# Altium schematic sheet RJ-45_OUTPUT.SchDoc
size 420 x 297 mm; Author: Лотов М.Д.; Address1: Address1; Address2: Address2; Address3: Address3; Address4: Address4; DocumentNumber: RJ-45_OUTPUT; SheetNumber: 3; SheetTotal: 5; Scale: 1:1; DocumentType: Схема электрическая принципиальная; FirstReferrence: АБВГ.123456.001
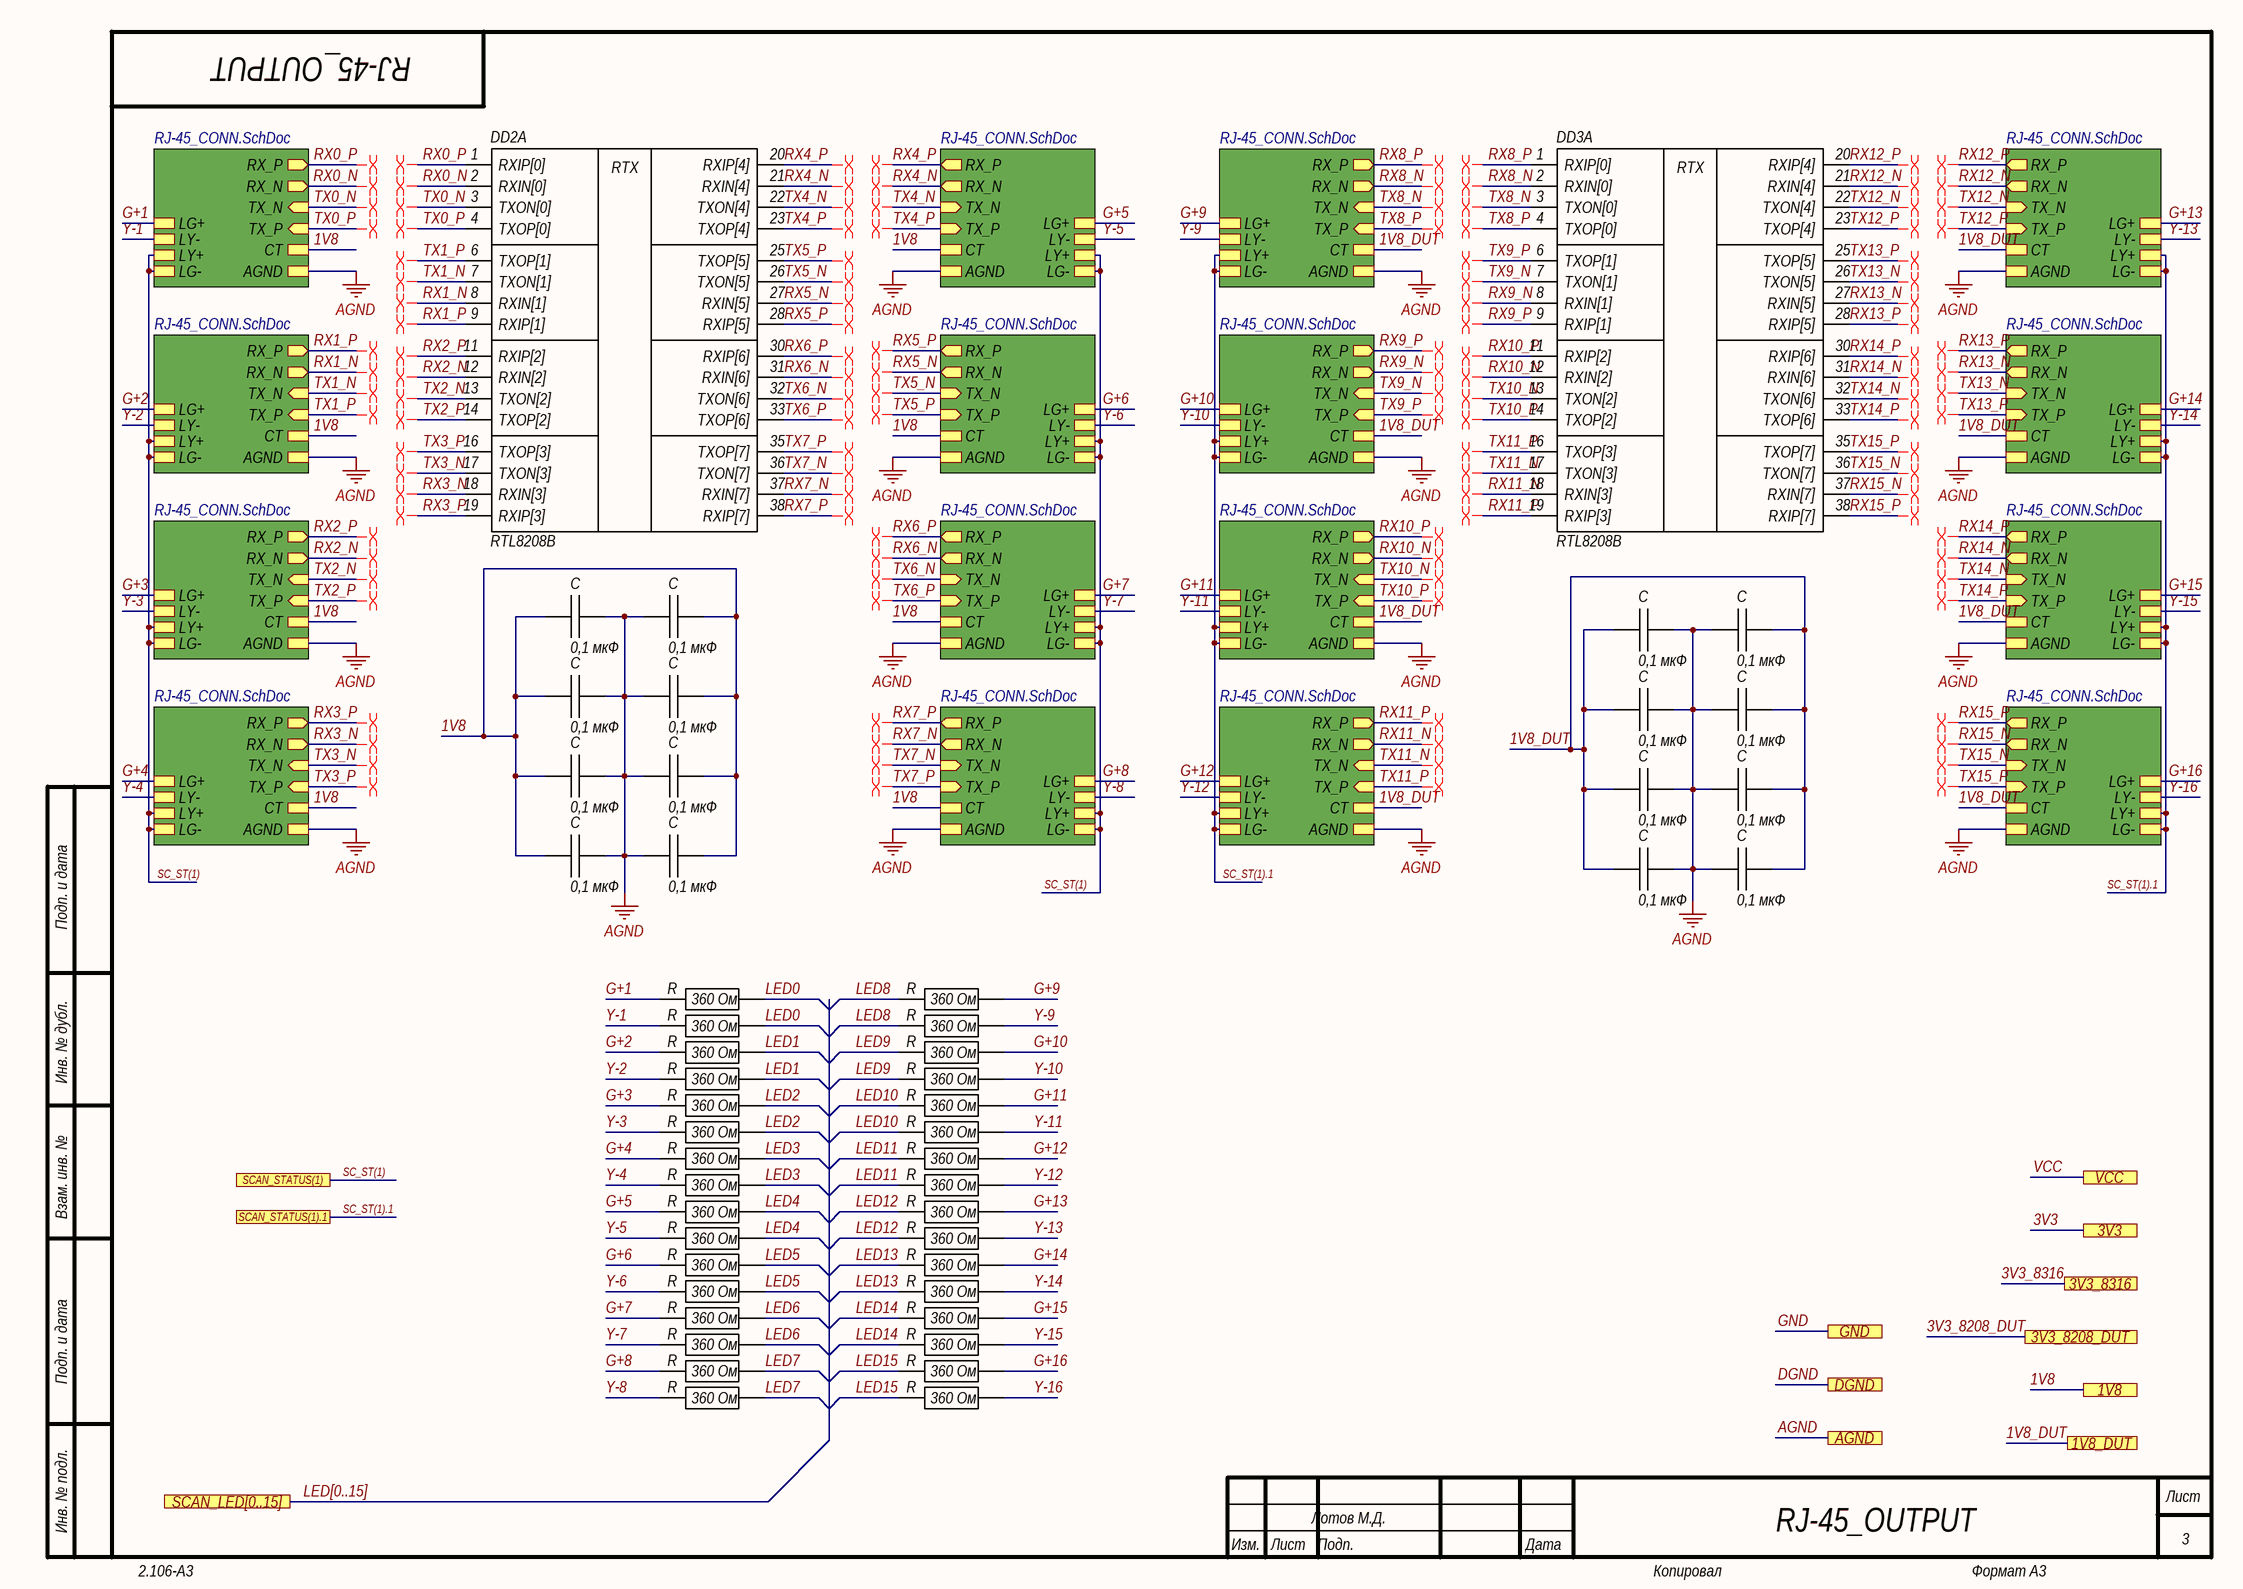
[diagram p0: RJ-45_OUTPUT.SchDoc]

## Parts
(Parts that share a designator on the sheet are numbered #1, #2 ... from top to bottom, then left to right.)
C#1  0,1 мкФ  [C0603]
C#2  0,1 мкФ  [C0603]
C#3  0,1 мкФ  [C0603]
C#4  0,1 мкФ  [C0603]
C#5  0,1 мкФ  [C0603]
C#6  0,1 мкФ  [C0603]
C#7  0,1 мкФ  [C0603]
C#8  0,1 мкФ  [C0603]
C#9  0,1 мкФ  [C0603]
C#10  0,1 мкФ  [C0603]
C#11  0,1 мкФ  [C0603]
C#12  0,1 мкФ  [C0603]
C#13  0,1 мкФ  [C0603]
C#14  0,1 мкФ  [C0603]
C#15  0,1 мкФ  [C0603]
C#16  0,1 мкФ  [C0603]
DD2  RTL8208B  [QFP-128_14x20mm_0.5mm]  (part A of 4)
DD3  RTL8208B  [QFP-128_(14x20mm)_0.5mm_ZIF]  (part A of 4)
R#1  360 Ом  [R0603]
R#2  360 Ом  [R0603]
R#3  360 Ом  [R0603]
R#4  360 Ом  [R0603]
R#5  360 Ом  [R0603]
R#6  360 Ом  [R0603]
R#7  360 Ом  [R0603]
R#8  360 Ом  [R0603]
R#9  360 Ом  [R0603]
R#10  360 Ом  [R0603]
R#11  360 Ом  [R0603]
R#12  360 Ом  [R0603]
R#13  360 Ом  [R0603]
R#14  360 Ом  [R0603]
R#15  360 Ом  [R0603]
R#16  360 Ом  [R0603]
R#17  360 Ом  [R0603]
R#18  360 Ом  [R0603]
R#19  360 Ом  [R0603]
R#20  360 Ом  [R0603]
R#21  360 Ом  [R0603]
R#22  360 Ом  [R0603]
R#23  360 Ом  [R0603]
R#24  360 Ом  [R0603]
R#25  360 Ом  [R0603]
R#26  360 Ом  [R0603]
R#27  360 Ом  [R0603]
R#28  360 Ом  [R0603]
R#29  360 Ом  [R0603]
R#30  360 Ом  [R0603]
R#31  360 Ом  [R0603]
R#32  360 Ом  [R0603]

## Sub-sheets
RJ45_1 = RJ-45_CONN.SchDoc: RX_P (out), CT, AGND, TX_P (in), RX_N (out), TX_N (in), LG+, LY-, LY+, LG-
RJ45_2 = RJ-45_CONN.SchDoc: RX_P (out), CT, AGND, TX_P (in), RX_N (out), TX_N (in), LG+, LY-, LY+, LG-
RJ45_3 = RJ-45_CONN.SchDoc: RX_P (out), CT, AGND, TX_P (in), RX_N (out), TX_N (in), LG+, LY-, LY+, LG-
RJ45_4 = RJ-45_CONN.SchDoc: RX_P (out), CT, AGND, TX_P (in), RX_N (out), TX_N (in), LG+, LY-, LY+, LG-
RJ45_5 = RJ-45_CONN.SchDoc: RX_P (out), CT, AGND, TX_P (in), RX_N (out), TX_N (in), LG+, LY-, LY+, LG-
RJ45_6 = RJ-45_CONN.SchDoc: RX_P (out), CT, AGND, TX_P (in), RX_N (out), TX_N (in), LG+, LY-, LY+, LG-
RJ45_7 = RJ-45_CONN.SchDoc: RX_P (out), CT, AGND, TX_P (in), RX_N (out), TX_N (in), LG+, LY-, LY+, LG-
RJ45_8 = RJ-45_CONN.SchDoc: RX_P (out), CT, AGND, TX_P (in), RX_N (out), TX_N (in), LG+, LY-, LY+, LG-
RJ45_9 = RJ-45_CONN.SchDoc: RX_P (out), CT, AGND, TX_P (in), RX_N (out), TX_N (in), LG+, LY-, LY+, LG-
RJ45_10 = RJ-45_CONN.SchDoc: RX_P (out), CT, AGND, TX_P (in), RX_N (out), TX_N (in), LG+, LY-, LY+, LG-
RJ45_11 = RJ-45_CONN.SchDoc: RX_P (out), CT, AGND, TX_P (in), RX_N (out), TX_N (in), LG+, LY-, LY+, LG-
RJ45_12 = RJ-45_CONN.SchDoc: RX_P (out), CT, AGND, TX_P (in), RX_N (out), TX_N (in), LG+, LY-, LY+, LG-
RJ45_13 = RJ-45_CONN.SchDoc: RX_P (out), CT, AGND, TX_P (in), RX_N (out), TX_N (in), LG+, LY-, LY+, LG-
RJ45_14 = RJ-45_CONN.SchDoc: RX_P (out), CT, AGND, TX_P (in), RX_N (out), TX_N (in), LG+, LY-, LY+, LG-
RJ45_15 = RJ-45_CONN.SchDoc: RX_P (out), CT, AGND, TX_P (in), RX_N (out), TX_N (in), LG+, LY-, LY+, LG-
RJ45_16 = RJ-45_CONN.SchDoc: RX_P (out), CT, AGND, TX_P (in), RX_N (out), TX_N (in), LG+, LY-, LY+, LG-

## Ports
1V8, 1V8_DUT, 3V3, 3V3_8208_DUT, 3V3_8316, AGND, DGND, GND, SCAN_LED[0..15], SCAN_STATUS(1), SCAN_STATUS(1).1, VCC

## Nets
AGND: C#1.2 C#2.2 C#3.2 C#4.2 C#5.2 C#6.2 C#7.2 C#8.2 C#9.2 C#10.2 C#11.2 C#12.2 C#13.2 C#14.2 C#15.2 C#16.2 ; port AGND, sheet RJ45_1/AGND, sheet RJ45_2/AGND, sheet RJ45_3/AGND, sheet RJ45_4/AGND, sheet RJ45_9/AGND, sheet RJ45_10/AGND, sheet RJ45_11/AGND, sheet RJ45_12/AGND, sheet RJ45_5/AGND, sheet RJ45_6/AGND, sheet RJ45_7/AGND, sheet RJ45_8/AGND, sheet RJ45_13/AGND, sheet RJ45_14/AGND, sheet RJ45_15/AGND, sheet RJ45_16/AGND
1V8: C#1.1 C#2.1 C#5.1 C#6.1 C#9.1 C#10.1 C#13.1 C#14.1 ; port 1V8, sheet RJ45_1/CT, sheet RJ45_2/CT, sheet RJ45_3/CT, sheet RJ45_4/CT, sheet RJ45_5/CT, sheet RJ45_6/CT, sheet RJ45_7/CT, sheet RJ45_8/CT
1V8_DUT: C#3.1 C#4.1 C#7.1 C#8.1 C#11.1 C#12.1 C#15.1 C#16.1 ; port 1V8_DUT, sheet RJ45_9/CT, sheet RJ45_10/CT, sheet RJ45_11/CT, sheet RJ45_12/CT, sheet RJ45_13/CT, sheet RJ45_14/CT, sheet RJ45_15/CT, sheet RJ45_16/CT
3V3: port 3V3
3V3_8208_DUT: port 3V3_8208_DUT
3V3_8316: port 3V3_8316
DGND: port DGND
G+1: R#1.1(x) ; sheet RJ45_1/LG+
G+2: R#5.1(x) ; sheet RJ45_2/LG+
G+3: R#9.1(x) ; sheet RJ45_3/LG+
G+4: R#13.1(x) ; sheet RJ45_4/LG+
G+5: R#17.1(x) ; sheet RJ45_5/LG+
G+6: R#21.1(x) ; sheet RJ45_6/LG+
G+7: R#25.1(x) ; sheet RJ45_7/LG+
G+8: R#29.1(x) ; sheet RJ45_8/LG+
G+9: R#2.2 ; sheet RJ45_9/LG+
G+10: R#6.2 ; sheet RJ45_10/LG+
G+11: R#10.2 ; sheet RJ45_11/LG+
G+12: R#14.2 ; sheet RJ45_12/LG+
G+13: R#18.2 ; sheet RJ45_13/LG+
G+14: R#22.2 ; sheet RJ45_14/LG+
G+15: R#26.2 ; sheet RJ45_15/LG+
G+16: R#30.2 ; sheet RJ45_16/LG+
GND: port GND
LED0: R#1.2 R#3.2
LED1: R#5.2 R#7.2
LED2: R#9.2 R#11.2
LED3: R#13.2 R#15.2
LED4: R#17.2 R#19.2
LED5: R#21.2 R#23.2
LED6: R#25.2 R#27.2
LED7: R#29.2 R#31.2
LED8: R#2.1(x) R#4.1(x)
LED9: R#6.1(x) R#8.1(x)
LED10: R#10.1(x) R#12.1(x)
LED11: R#14.1(x) R#16.1(x)
LED12: R#18.1(x) R#20.1(x)
LED13: R#22.1(x) R#24.1(x)
LED14: R#26.1(x) R#28.1(x)
LED15: R#30.1(x) R#32.1(x)
RX0_N: DD2.2(RXIN[0]) ; sheet RJ45_1/RX_N
RX0_P: DD2.1(RXIP[0]) ; sheet RJ45_1/RX_P
RX1_N: DD2.8(RXIN[1]) ; sheet RJ45_2/RX_N
RX1_P: DD2.9(RXIP[1]) ; sheet RJ45_2/RX_P
RX2_N: DD2.12(RXIN[2]) ; sheet RJ45_3/RX_N
RX2_P: DD2.11(RXIP[2]) ; sheet RJ45_3/RX_P
RX3_N: DD2.18(RXIN[3]) ; sheet RJ45_4/RX_N
RX3_P: DD2.19(RXIP[3]) ; sheet RJ45_4/RX_P
RX4_N: DD2.21(RXIN[4]) ; sheet RJ45_5/RX_N
RX4_P: DD2.20(RXIP[4]) ; sheet RJ45_5/RX_P
RX5_N: DD2.27(RXIN[5]) ; sheet RJ45_6/RX_N
RX5_P: DD2.28(RXIP[5]) ; sheet RJ45_6/RX_P
RX6_N: DD2.31(RXIN[6]) ; sheet RJ45_7/RX_N
RX6_P: DD2.30(RXIP[6]) ; sheet RJ45_7/RX_P
RX7_N: DD2.37(RXIN[7]) ; sheet RJ45_8/RX_N
RX7_P: DD2.38(RXIP[7]) ; sheet RJ45_8/RX_P
RX8_N: DD3.2(RXIN[0]) ; sheet RJ45_9/RX_N
RX8_P: DD3.1(RXIP[0]) ; sheet RJ45_9/RX_P
RX9_N: DD3.8(RXIN[1]) ; sheet RJ45_10/RX_N
RX9_P: DD3.9(RXIP[1]) ; sheet RJ45_10/RX_P
RX10_N: DD3.12(RXIN[2]) ; sheet RJ45_11/RX_N
RX10_P: DD3.11(RXIP[2]) ; sheet RJ45_11/RX_P
RX11_N: DD3.18(RXIN[3]) ; sheet RJ45_12/RX_N
RX11_P: DD3.19(RXIP[3]) ; sheet RJ45_12/RX_P
RX12_N: DD3.21(RXIN[4]) ; sheet RJ45_13/RX_N
RX12_P: DD3.20(RXIP[4]) ; sheet RJ45_13/RX_P
RX13_N: DD3.27(RXIN[5]) ; sheet RJ45_14/RX_N
RX13_P: DD3.28(RXIP[5]) ; sheet RJ45_14/RX_P
RX14_N: DD3.31(RXIN[6]) ; sheet RJ45_15/RX_N
RX14_P: DD3.30(RXIP[6]) ; sheet RJ45_15/RX_P
RX15_N: DD3.37(RXIN[7]) ; sheet RJ45_16/RX_N
RX15_P: DD3.38(RXIP[7]) ; sheet RJ45_16/RX_P
SC_ST(1): port SCAN_STATUS(1), sheet RJ45_1/LY+, sheet RJ45_1/LG-, sheet RJ45_2/LY+, sheet RJ45_2/LG-, sheet RJ45_3/LY+, sheet RJ45_3/LG-, sheet RJ45_4/LY+, sheet RJ45_4/LG-, sheet RJ45_5/LY+, sheet RJ45_5/LG-, sheet RJ45_6/LY+, sheet RJ45_6/LG-, sheet RJ45_7/LY+, sheet RJ45_7/LG-, sheet RJ45_8/LY+, sheet RJ45_8/LG-
SC_ST(1).1: port SCAN_STATUS(1).1, sheet RJ45_9/LY+, sheet RJ45_9/LG-, sheet RJ45_10/LY+, sheet RJ45_10/LG-, sheet RJ45_11/LY+, sheet RJ45_11/LG-, sheet RJ45_12/LY+, sheet RJ45_12/LG-, sheet RJ45_13/LY+, sheet RJ45_13/LG-, sheet RJ45_14/LY+, sheet RJ45_14/LG-, sheet RJ45_15/LY+, sheet RJ45_15/LG-, sheet RJ45_16/LY+, sheet RJ45_16/LG-
TX0_N: DD2.3(TXON[0]) ; sheet RJ45_1/TX_N
TX0_P: DD2.4(TXOP[0]) ; sheet RJ45_1/TX_P
TX1_N: DD2.7(TXON[1]) ; sheet RJ45_2/TX_N
TX1_P: DD2.6(TXOP[1]) ; sheet RJ45_2/TX_P
TX2_N: DD2.13(TXON[2]) ; sheet RJ45_3/TX_N
TX2_P: DD2.14(TXOP[2]) ; sheet RJ45_3/TX_P
TX3_N: DD2.17(TXON[3]) ; sheet RJ45_4/TX_N
TX3_P: DD2.16(TXOP[3]) ; sheet RJ45_4/TX_P
TX4_N: DD2.22(TXON[4]) ; sheet RJ45_5/TX_N
TX4_P: DD2.23(TXOP[4]) ; sheet RJ45_5/TX_P
TX5_N: DD2.26(TXON[5]) ; sheet RJ45_6/TX_N
TX5_P: DD2.25(TXOP[5]) ; sheet RJ45_6/TX_P
TX6_N: DD2.32(TXON[6]) ; sheet RJ45_7/TX_N
TX6_P: DD2.33(TXOP[6]) ; sheet RJ45_7/TX_P
TX7_N: DD2.36(TXON[7]) ; sheet RJ45_8/TX_N
TX7_P: DD2.35(TXOP[7]) ; sheet RJ45_8/TX_P
TX8_N: DD3.3(TXON[0]) ; sheet RJ45_9/TX_N
TX8_P: DD3.4(TXOP[0]) ; sheet RJ45_9/TX_P
TX9_N: DD3.7(TXON[1]) ; sheet RJ45_10/TX_N
TX9_P: DD3.6(TXOP[1]) ; sheet RJ45_10/TX_P
TX10_N: DD3.13(TXON[2]) ; sheet RJ45_11/TX_N
TX10_P: DD3.14(TXOP[2]) ; sheet RJ45_11/TX_P
TX11_N: DD3.17(TXON[3]) ; sheet RJ45_12/TX_N
TX11_P: DD3.16(TXOP[3]) ; sheet RJ45_12/TX_P
TX12_N: DD3.22(TXON[4]) ; sheet RJ45_13/TX_N
TX12_P: DD3.23(TXOP[4]) ; sheet RJ45_13/TX_P
TX13_N: DD3.26(TXON[5]) ; sheet RJ45_14/TX_N
TX13_P: DD3.25(TXOP[5]) ; sheet RJ45_14/TX_P
TX14_N: DD3.32(TXON[6]) ; sheet RJ45_15/TX_N
TX14_P: DD3.33(TXOP[6]) ; sheet RJ45_15/TX_P
TX15_N: DD3.36(TXON[7]) ; sheet RJ45_16/TX_N
TX15_P: DD3.35(TXOP[7]) ; sheet RJ45_16/TX_P
VCC: port VCC
Y-1: R#3.1(x) ; sheet RJ45_1/LY-
Y-2: R#7.1(x) ; sheet RJ45_2/LY-
Y-3: R#11.1(x) ; sheet RJ45_3/LY-
Y-4: R#15.1(x) ; sheet RJ45_4/LY-
Y-5: R#19.1(x) ; sheet RJ45_5/LY-
Y-6: R#23.1(x) ; sheet RJ45_6/LY-
Y-7: R#27.1(x) ; sheet RJ45_7/LY-
Y-8: R#31.1(x) ; sheet RJ45_8/LY-
Y-9: R#4.2 ; sheet RJ45_9/LY-
Y-10: R#8.2 ; sheet RJ45_10/LY-
Y-11: R#12.2 ; sheet RJ45_11/LY-
Y-12: R#16.2 ; sheet RJ45_12/LY-
Y-13: R#20.2 ; sheet RJ45_13/LY-
Y-14: R#24.2 ; sheet RJ45_14/LY-
Y-15: R#28.2 ; sheet RJ45_15/LY-
Y-16: R#32.2 ; sheet RJ45_16/LY-

## Buses and harness runs
bus LED[0..15] = port SCAN_LED[0..15]

## Layout directives
differential pair: RX0_N, RX0_P, RX1_N, RX1_P, RX2_N, RX2_P, RX3_N, RX3_P, RX4_N, RX4_P, RX5_N, RX5_P, RX6_N, RX6_P, RX7_N, RX7_P, RX8_N, RX8_P, RX9_N, RX9_P, RX10_N, RX10_P, RX11_N, RX11_P, RX12_N, RX12_P, RX13_N, RX13_P, RX14_N, RX14_P, RX15_N, RX15_P, TX0_N, TX0_P, TX1_N, TX1_P, TX2_N, TX2_P, TX3_N, TX3_P, TX4_N, TX4_P, TX5_N, TX5_P, TX6_N, TX6_P, TX7_N, TX7_P, TX8_N, TX8_P, TX9_N, TX9_P, TX10_N, TX10_P, TX11_N, TX11_P, TX12_N, TX12_P, TX13_N, TX13_P, TX14_N, TX14_P, TX15_N, TX15_P

## Notes on the sheet
- Подп. и дата
- Инв. № дубл.
- Взам. инв. №
- Инв. № подл.
- Изм.
- Лист
- Подп.
- Дата
- 2.106-A3
- Копировал
- Формат А3
- (in symbol RTL8208B, part A) RTX

## Library data of the parts
C#1-C#16 = Capacitance_SMD
R#1-R#32 = Resistor_SMD